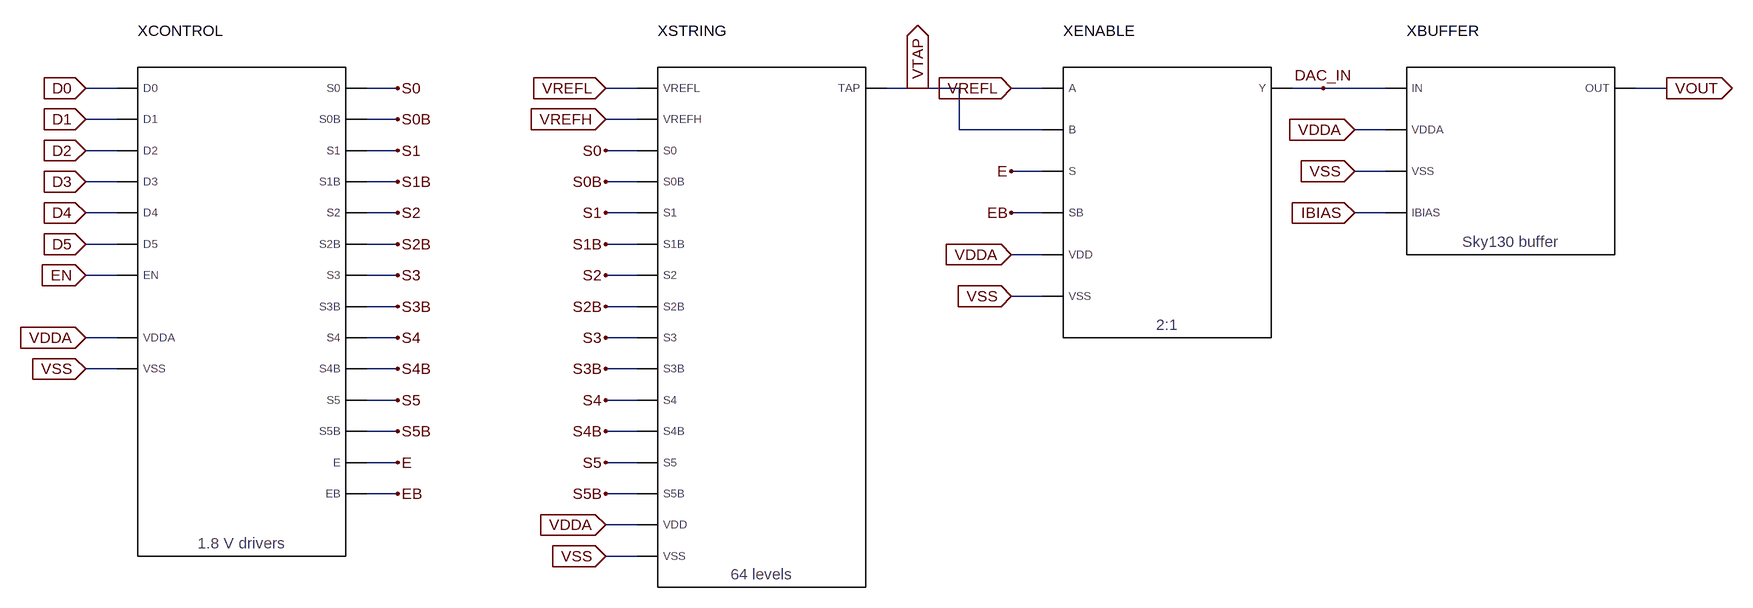
[diagram p0: schematic DAC6_Sky130_Core.asc]
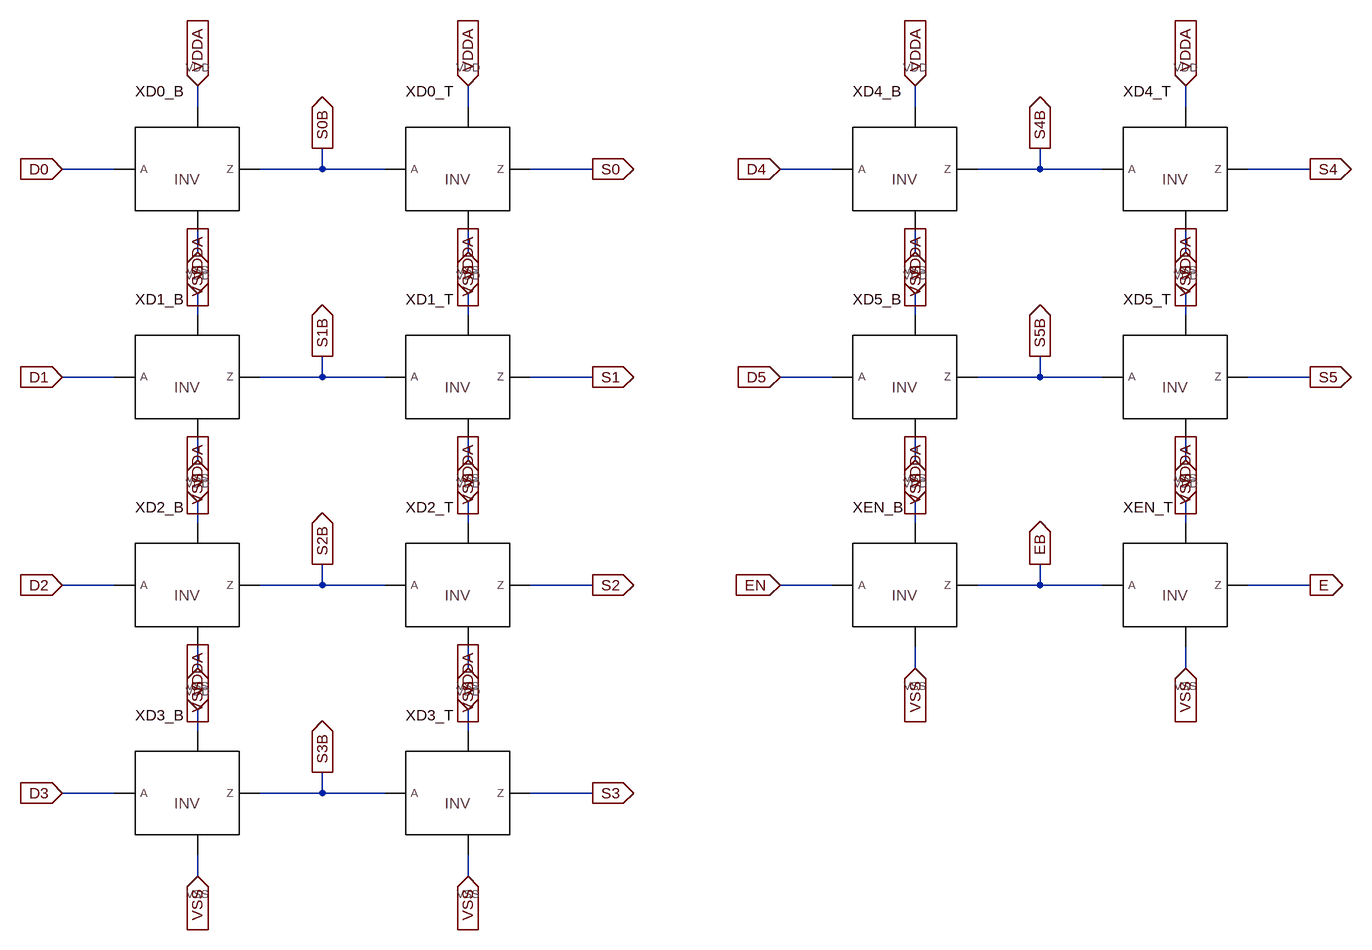
[diagram p1: sub-circuit dac_control.asc]
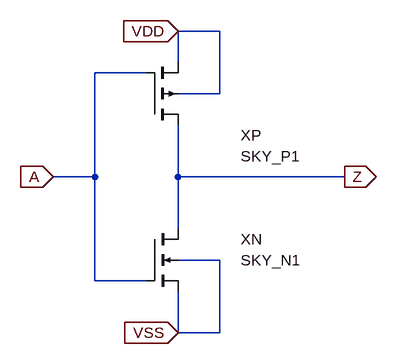
[diagram p2: sub-circuit cmos_inv.asc]
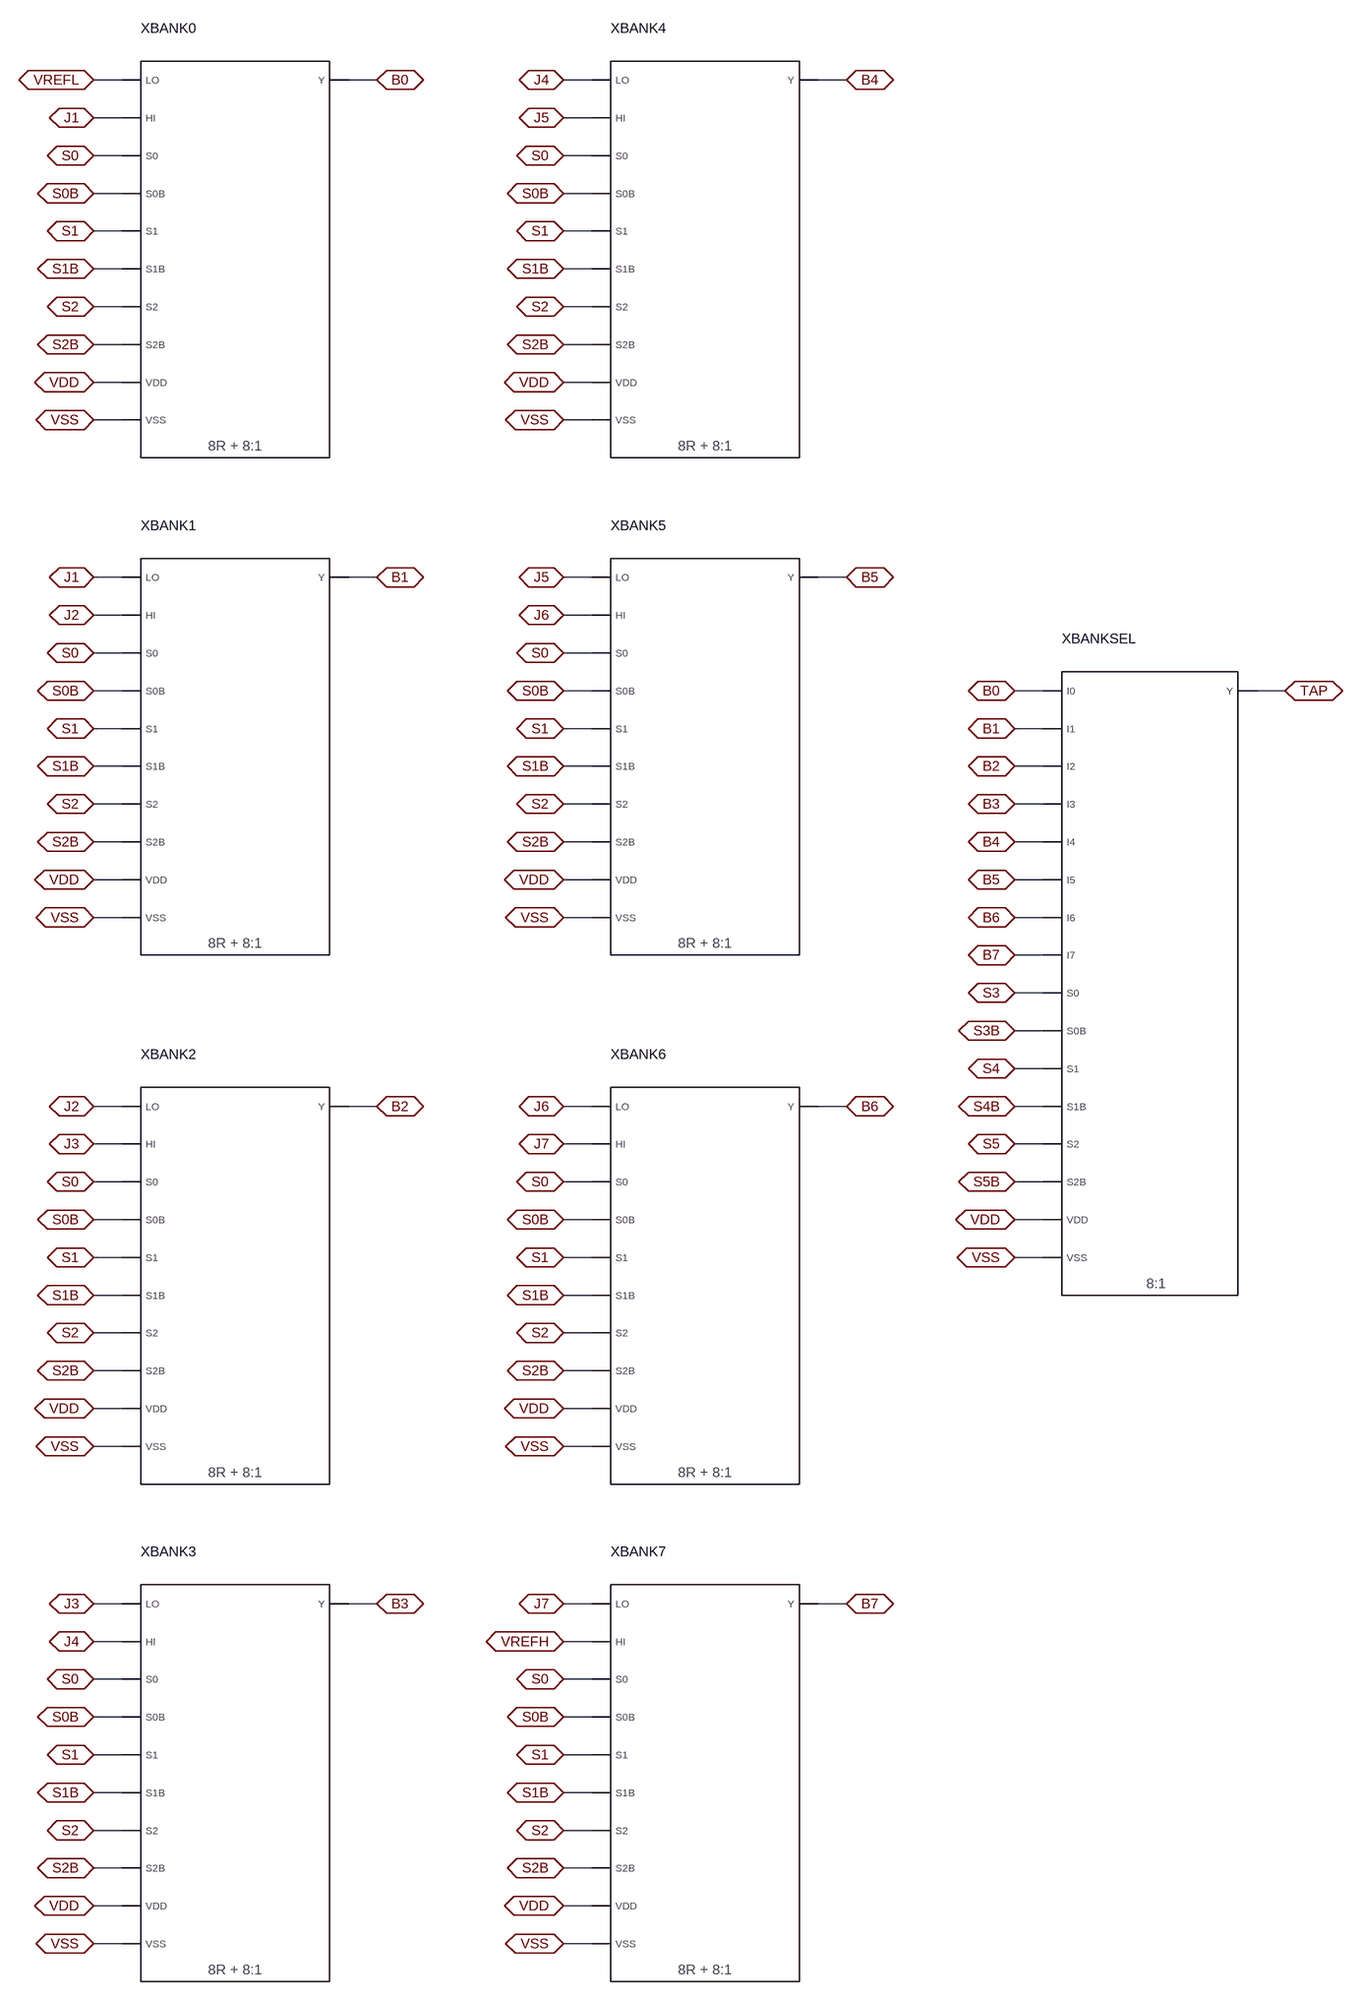
[diagram p3: sub-circuit dac_string64.asc]
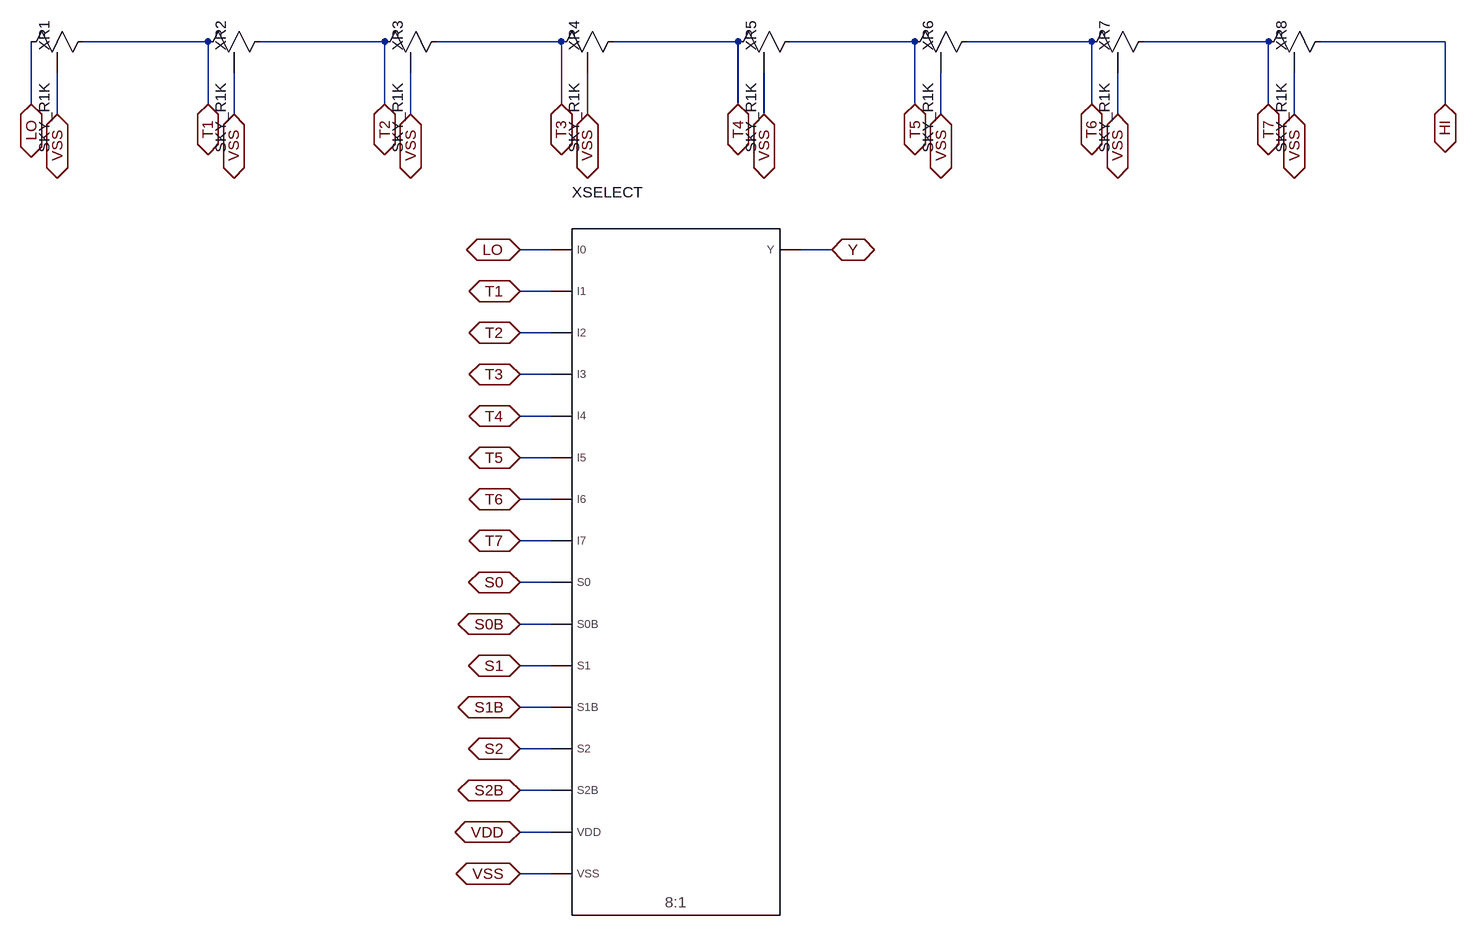
[diagram p4: sub-circuit dac_bank8.asc]
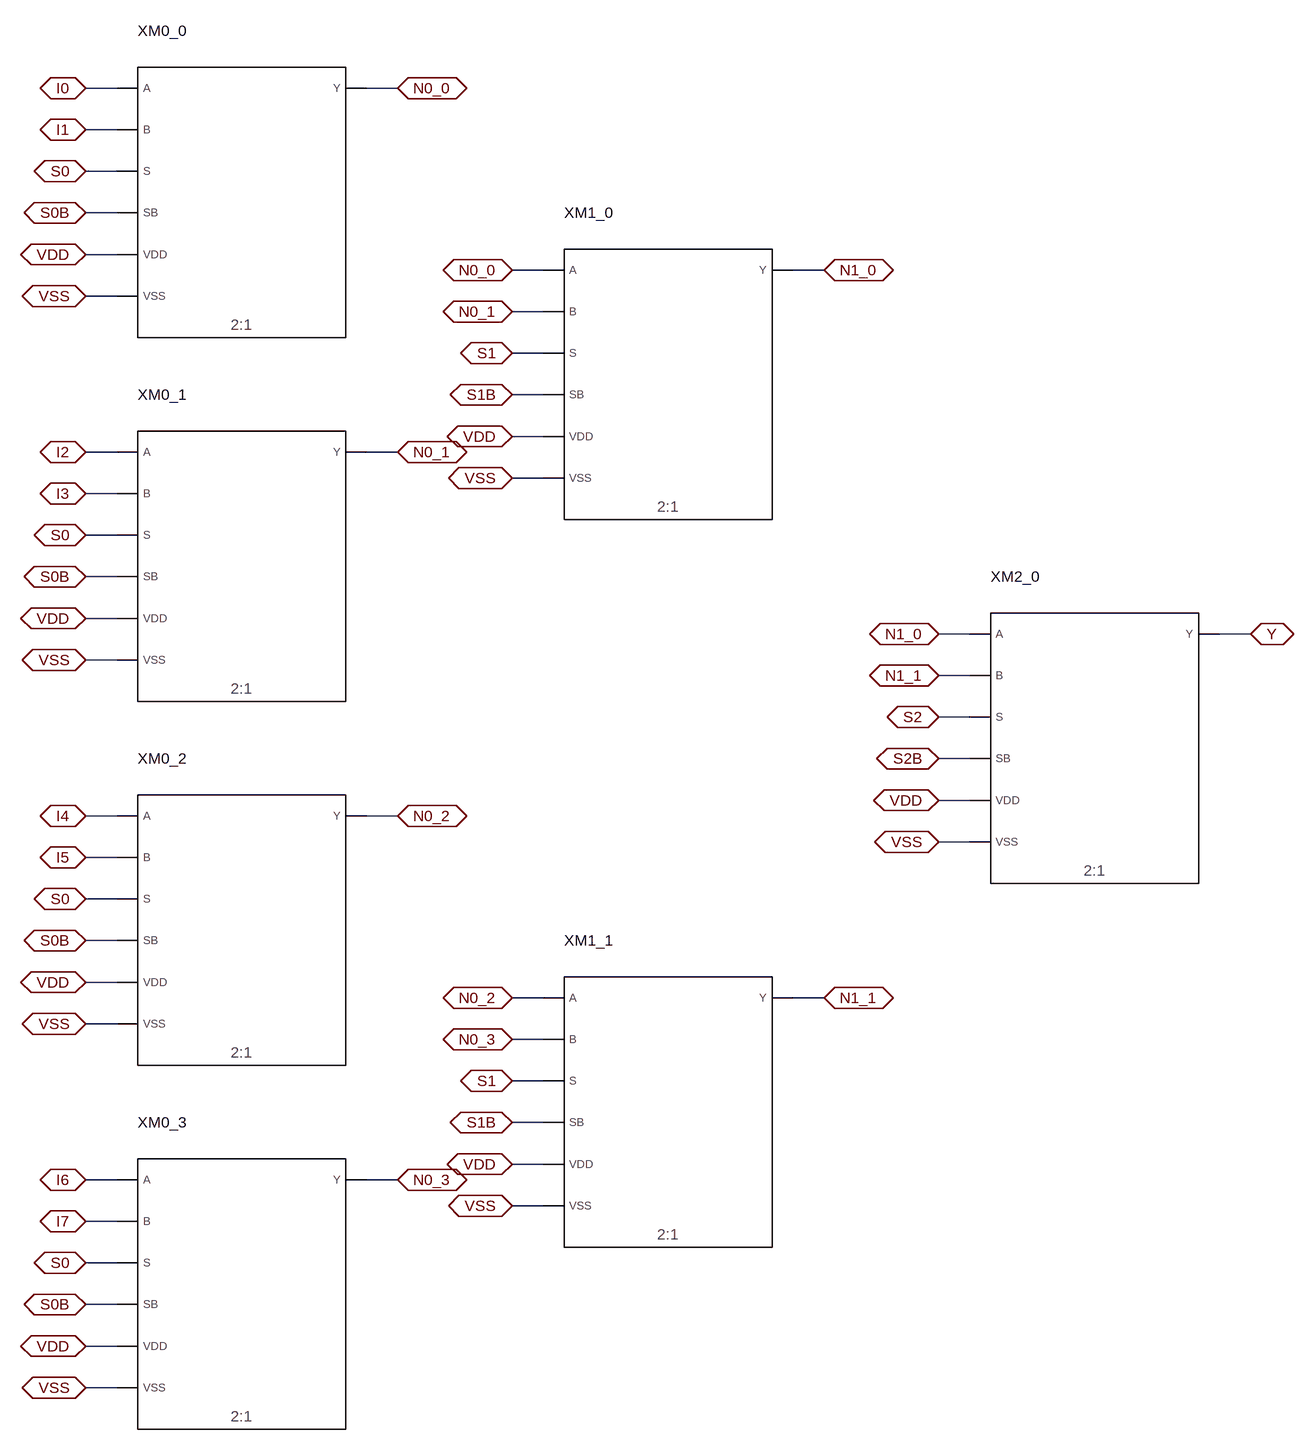
[diagram p5: sub-circuit dac_mux8.asc]
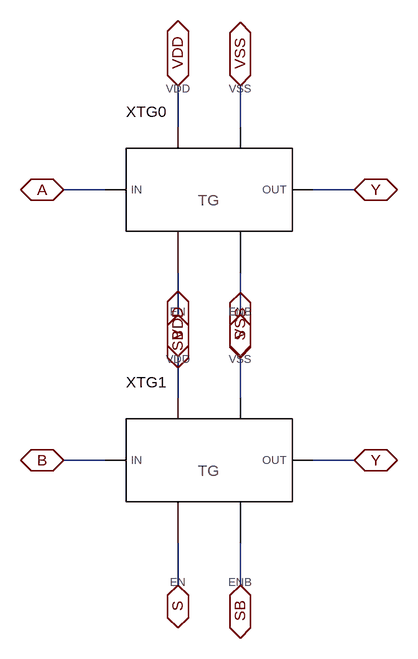
[diagram p6: sub-circuit dac_mux2.asc]
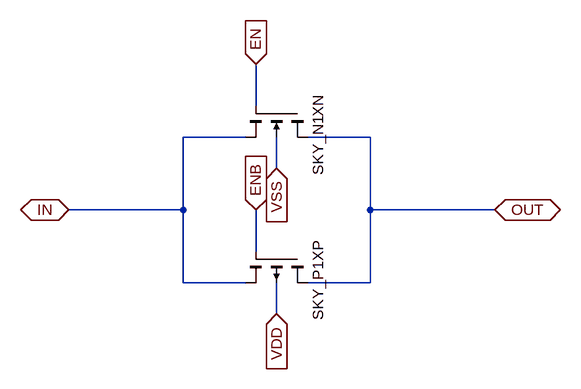
[diagram p7: sub-circuit cmos_tg.asc]
DAC6_Sky130_Core.asc, the LTspice schematic file:
Version 4.1
SHEET 1 2816 1136
WIRE 224 192 176 192
WIRE 224 240 176 240
WIRE 224 288 176 288
WIRE 224 336 176 336
WIRE 224 384 176 384
WIRE 224 432 176 432
WIRE 224 480 176 480
WIRE 224 576 176 576
WIRE 224 624 176 624
WIRE 608 192 656 192
WIRE 608 240 656 240
WIRE 608 288 656 288
WIRE 608 336 656 336
WIRE 608 384 656 384
WIRE 608 432 656 432
WIRE 608 480 656 480
WIRE 608 528 656 528
WIRE 608 576 656 576
WIRE 608 624 656 624
WIRE 608 672 656 672
WIRE 608 720 656 720
WIRE 608 768 656 768
WIRE 608 816 656 816
WIRE 1024 192 976 192
WIRE 1024 240 976 240
WIRE 1024 288 976 288
WIRE 1024 336 976 336
WIRE 1024 384 976 384
WIRE 1024 432 976 432
WIRE 1024 480 976 480
WIRE 1024 528 976 528
WIRE 1024 576 976 576
WIRE 1024 624 976 624
WIRE 1024 672 976 672
WIRE 1024 720 976 720
WIRE 1024 768 976 768
WIRE 1024 816 976 816
WIRE 1024 864 976 864
WIRE 1024 912 976 912
WIRE 1648 192 1600 192
WIRE 1648 320 1600 320
WIRE 1648 384 1600 384
WIRE 1648 448 1600 448
WIRE 1648 512 1600 512
WIRE 2176 256 2128 256
WIRE 2176 320 2128 320
WIRE 2560 192 2608 192
WIRE 1408 192 1520 192
WIRE 1520 192 1520 256
WIRE 1520 256 1648 256
WIRE 2032 192 2176 192
WIRE 2176 384 2128 384
FLAG 176 192 D0
IOPIN 176 192 In
FLAG 176 240 D1
IOPIN 176 240 In
FLAG 176 288 D2
IOPIN 176 288 In
FLAG 176 336 D3
IOPIN 176 336 In
FLAG 176 384 D4
IOPIN 176 384 In
FLAG 176 432 D5
IOPIN 176 432 In
FLAG 176 480 EN
IOPIN 176 480 In
FLAG 176 576 VDDA
IOPIN 176 576 In
FLAG 176 624 VSS
IOPIN 176 624 In
FLAG 656 192 S0
FLAG 656 240 S0B
FLAG 656 288 S1
FLAG 656 336 S1B
FLAG 656 384 S2
FLAG 656 432 S2B
FLAG 656 480 S3
FLAG 656 528 S3B
FLAG 656 576 S4
FLAG 656 624 S4B
FLAG 656 672 S5
FLAG 656 720 S5B
FLAG 656 768 E
FLAG 656 816 EB
FLAG 976 192 VREFL
IOPIN 976 192 In
FLAG 976 240 VREFH
IOPIN 976 240 In
FLAG 976 288 S0
FLAG 976 336 S0B
FLAG 976 384 S1
FLAG 976 432 S1B
FLAG 976 480 S2
FLAG 976 528 S2B
FLAG 976 576 S3
FLAG 976 624 S3B
FLAG 976 672 S4
FLAG 976 720 S4B
FLAG 976 768 S5
FLAG 976 816 S5B
FLAG 976 864 VDDA
IOPIN 976 864 In
FLAG 976 912 VSS
IOPIN 976 912 In
FLAG 1600 192 VREFL
IOPIN 1600 192 In
FLAG 1600 320 E
FLAG 1600 384 EB
FLAG 1600 448 VDDA
IOPIN 1600 448 In
FLAG 1600 512 VSS
IOPIN 1600 512 In
FLAG 2128 256 VDDA
IOPIN 2128 256 In
FLAG 2128 320 VSS
IOPIN 2128 320 In
FLAG 2608 192 VOUT
IOPIN 2608 192 Out
FLAG 1456 192 VTAP
IOPIN 1456 192 Out
FLAG 2080 192 DAC_IN
FLAG 2128 384 IBIAS
IOPIN 2128 384 In
SYMBOL DAC_Control 224 128 R0
WINDOW 0 32 -24 Left 2
SYMATTR InstName XCONTROL
SYMBOL DAC_String64 1024 128 R0
WINDOW 0 32 -24 Left 2
SYMATTR InstName XSTRING
SYMBOL DAC_Mux2 1648 128 R0
WINDOW 0 32 -24 Left 2
SYMATTR InstName XENABLE
SYMBOL DAC_Buffer 2176 128 R0
WINDOW 0 32 -24 Left 2
SYMATTR InstName XBUFFER

dac_control.asc, the sub-circuit schematic file:
Version 4.1
SHEET 1 2176 1440
WIRE 192 192 112 192
WIRE 512 192 416 192
WIRE 608 192 512 192
WIRE 512 160 512 192
WIRE 928 192 832 192
WIRE 320 96 320 64
WIRE 320 320 320 288
WIRE 736 96 736 64
WIRE 736 320 736 288
WIRE 192 512 112 512
WIRE 512 512 416 512
WIRE 608 512 512 512
WIRE 512 480 512 512
WIRE 928 512 832 512
WIRE 320 416 320 384
WIRE 320 640 320 608
WIRE 736 416 736 384
WIRE 736 640 736 608
WIRE 192 832 112 832
WIRE 512 832 416 832
WIRE 608 832 512 832
WIRE 512 800 512 832
WIRE 928 832 832 832
WIRE 320 736 320 704
WIRE 320 960 320 928
WIRE 736 736 736 704
WIRE 736 960 736 928
WIRE 192 1152 112 1152
WIRE 512 1152 416 1152
WIRE 608 1152 512 1152
WIRE 512 1120 512 1152
WIRE 928 1152 832 1152
WIRE 320 1056 320 1024
WIRE 320 1280 320 1248
WIRE 736 1056 736 1024
WIRE 736 1280 736 1248
WIRE 1296 192 1216 192
WIRE 1616 192 1520 192
WIRE 1712 192 1616 192
WIRE 1616 160 1616 192
WIRE 2032 192 1936 192
WIRE 1424 96 1424 64
WIRE 1424 320 1424 288
WIRE 1840 96 1840 64
WIRE 1840 320 1840 288
WIRE 1296 512 1216 512
WIRE 1616 512 1520 512
WIRE 1712 512 1616 512
WIRE 1616 480 1616 512
WIRE 2032 512 1936 512
WIRE 1424 416 1424 384
WIRE 1424 640 1424 608
WIRE 1840 416 1840 384
WIRE 1840 640 1840 608
WIRE 1296 832 1216 832
WIRE 1616 832 1520 832
WIRE 1712 832 1616 832
WIRE 1616 800 1616 832
WIRE 2032 832 1936 832
WIRE 1424 736 1424 704
WIRE 1424 960 1424 928
WIRE 1840 736 1840 704
WIRE 1840 960 1840 928
FLAG 112 192 D0
IOPIN 112 192 In
FLAG 512 160 S0B
IOPIN 512 160 Out
FLAG 928 192 S0
IOPIN 928 192 Out
FLAG 320 64 VDDA
IOPIN 320 64 In
FLAG 320 320 VSS
IOPIN 320 320 In
FLAG 736 64 VDDA
IOPIN 736 64 In
FLAG 736 320 VSS
IOPIN 736 320 In
FLAG 112 512 D1
IOPIN 112 512 In
FLAG 512 480 S1B
IOPIN 512 480 Out
FLAG 928 512 S1
IOPIN 928 512 Out
FLAG 320 384 VDDA
IOPIN 320 384 In
FLAG 320 640 VSS
IOPIN 320 640 In
FLAG 736 384 VDDA
IOPIN 736 384 In
FLAG 736 640 VSS
IOPIN 736 640 In
FLAG 112 832 D2
IOPIN 112 832 In
FLAG 512 800 S2B
IOPIN 512 800 Out
FLAG 928 832 S2
IOPIN 928 832 Out
FLAG 320 704 VDDA
IOPIN 320 704 In
FLAG 320 960 VSS
IOPIN 320 960 In
FLAG 736 704 VDDA
IOPIN 736 704 In
FLAG 736 960 VSS
IOPIN 736 960 In
FLAG 112 1152 D3
IOPIN 112 1152 In
FLAG 512 1120 S3B
IOPIN 512 1120 Out
FLAG 928 1152 S3
IOPIN 928 1152 Out
FLAG 320 1024 VDDA
IOPIN 320 1024 In
FLAG 320 1280 VSS
IOPIN 320 1280 In
FLAG 736 1024 VDDA
IOPIN 736 1024 In
FLAG 736 1280 VSS
IOPIN 736 1280 In
FLAG 1216 192 D4
IOPIN 1216 192 In
FLAG 1616 160 S4B
IOPIN 1616 160 Out
FLAG 2032 192 S4
IOPIN 2032 192 Out
FLAG 1424 64 VDDA
IOPIN 1424 64 In
FLAG 1424 320 VSS
IOPIN 1424 320 In
FLAG 1840 64 VDDA
IOPIN 1840 64 In
FLAG 1840 320 VSS
IOPIN 1840 320 In
FLAG 1216 512 D5
IOPIN 1216 512 In
FLAG 1616 480 S5B
IOPIN 1616 480 Out
FLAG 2032 512 S5
IOPIN 2032 512 Out
FLAG 1424 384 VDDA
IOPIN 1424 384 In
FLAG 1424 640 VSS
IOPIN 1424 640 In
FLAG 1840 384 VDDA
IOPIN 1840 384 In
FLAG 1840 640 VSS
IOPIN 1840 640 In
FLAG 1216 832 EN
IOPIN 1216 832 In
FLAG 1616 800 EB
IOPIN 1616 800 Out
FLAG 2032 832 E
IOPIN 2032 832 Out
FLAG 1424 704 VDDA
IOPIN 1424 704 In
FLAG 1424 960 VSS
IOPIN 1424 960 In
FLAG 1840 704 VDDA
IOPIN 1840 704 In
FLAG 1840 960 VSS
IOPIN 1840 960 In
SYMBOL CMOS_INV 192 96 R0
SYMATTR InstName XD0_B
SYMBOL CMOS_INV 608 96 R0
SYMATTR InstName XD0_T
SYMBOL CMOS_INV 192 416 R0
SYMATTR InstName XD1_B
SYMBOL CMOS_INV 608 416 R0
SYMATTR InstName XD1_T
SYMBOL CMOS_INV 192 736 R0
SYMATTR InstName XD2_B
SYMBOL CMOS_INV 608 736 R0
SYMATTR InstName XD2_T
SYMBOL CMOS_INV 192 1056 R0
SYMATTR InstName XD3_B
SYMBOL CMOS_INV 608 1056 R0
SYMATTR InstName XD3_T
SYMBOL CMOS_INV 1296 96 R0
SYMATTR InstName XD4_B
SYMBOL CMOS_INV 1712 96 R0
SYMATTR InstName XD4_T
SYMBOL CMOS_INV 1296 416 R0
SYMATTR InstName XD5_B
SYMBOL CMOS_INV 1712 416 R0
SYMATTR InstName XD5_T
SYMBOL CMOS_INV 1296 736 R0
SYMATTR InstName XEN_B
SYMBOL CMOS_INV 1712 736 R0
SYMATTR InstName XEN_T

cmos_inv.asc, the sub-circuit schematic file:
Version 4.1
SHEET 1 960 704
WIRE 352 192 352 272
WIRE 352 272 352 352
WIRE 352 272 608 272
WIRE 304 112 224 112
WIRE 224 112 224 272
WIRE 224 272 224 432
WIRE 224 432 304 432
WIRE 224 272 160 272
WIRE 352 96 352 48
WIRE 352 144 416 144
WIRE 416 144 416 48
WIRE 416 48 352 48
WIRE 352 448 352 512
WIRE 352 400 416 400
WIRE 416 400 416 512
WIRE 416 512 352 512
FLAG 608 272 Z
IOPIN 608 272 Out
FLAG 160 272 A
IOPIN 160 272 In
FLAG 352 48 VDD
IOPIN 352 48 In
FLAG 352 512 VSS
IOPIN 352 512 In
SYMBOL pmos4 304 192 M180
WINDOW 0 144 -16 Left 2
WINDOW 3 144 -48 Left 2
SYMATTR InstName XP
SYMATTR Value SKY_P1
SYMATTR SpiceLine w=1 l=0.15 mult=2
SYMATTR Prefix X
SYMBOL nmos4 304 352 R0
WINDOW 0 144 16 Left 2
WINDOW 3 144 48 Left 2
SYMATTR InstName XN
SYMATTR Value SKY_N1
SYMATTR SpiceLine w=1 l=0.15 mult=1
SYMATTR Prefix X

dac_string64.asc, the sub-circuit schematic file:
Version 4.1
SHEET 1 2816 3824
WIRE 192 160 144 160
WIRE 192 224 144 224
WIRE 192 288 144 288
WIRE 192 352 144 352
WIRE 192 416 144 416
WIRE 192 480 144 480
WIRE 192 544 144 544
WIRE 192 608 144 608
WIRE 192 672 144 672
WIRE 192 736 144 736
WIRE 576 160 624 160
WIRE 192 1056 144 1056
WIRE 192 1120 144 1120
WIRE 192 1184 144 1184
WIRE 192 1248 144 1248
WIRE 192 1312 144 1312
WIRE 192 1376 144 1376
WIRE 192 1440 144 1440
WIRE 192 1504 144 1504
WIRE 192 1568 144 1568
WIRE 192 1632 144 1632
WIRE 576 1056 624 1056
WIRE 192 1952 144 1952
WIRE 192 2016 144 2016
WIRE 192 2080 144 2080
WIRE 192 2144 144 2144
WIRE 192 2208 144 2208
WIRE 192 2272 144 2272
WIRE 192 2336 144 2336
WIRE 192 2400 144 2400
WIRE 192 2464 144 2464
WIRE 192 2528 144 2528
WIRE 576 1952 624 1952
WIRE 192 2848 144 2848
WIRE 192 2912 144 2912
WIRE 192 2976 144 2976
WIRE 192 3040 144 3040
WIRE 192 3104 144 3104
WIRE 192 3168 144 3168
WIRE 192 3232 144 3232
WIRE 192 3296 144 3296
WIRE 192 3360 144 3360
WIRE 192 3424 144 3424
WIRE 576 2848 624 2848
WIRE 1120 160 1072 160
WIRE 1120 224 1072 224
WIRE 1120 288 1072 288
WIRE 1120 352 1072 352
WIRE 1120 416 1072 416
WIRE 1120 480 1072 480
WIRE 1120 544 1072 544
WIRE 1120 608 1072 608
WIRE 1120 672 1072 672
WIRE 1120 736 1072 736
WIRE 1504 160 1552 160
WIRE 1120 1056 1072 1056
WIRE 1120 1120 1072 1120
WIRE 1120 1184 1072 1184
WIRE 1120 1248 1072 1248
WIRE 1120 1312 1072 1312
WIRE 1120 1376 1072 1376
WIRE 1120 1440 1072 1440
WIRE 1120 1504 1072 1504
WIRE 1120 1568 1072 1568
WIRE 1120 1632 1072 1632
WIRE 1504 1056 1552 1056
WIRE 1120 1952 1072 1952
WIRE 1120 2016 1072 2016
WIRE 1120 2080 1072 2080
WIRE 1120 2144 1072 2144
WIRE 1120 2208 1072 2208
WIRE 1120 2272 1072 2272
WIRE 1120 2336 1072 2336
WIRE 1120 2400 1072 2400
WIRE 1120 2464 1072 2464
WIRE 1120 2528 1072 2528
WIRE 1504 1952 1552 1952
WIRE 1120 2848 1072 2848
WIRE 1120 2912 1072 2912
WIRE 1120 2976 1072 2976
WIRE 1120 3040 1072 3040
WIRE 1120 3104 1072 3104
WIRE 1120 3168 1072 3168
WIRE 1120 3232 1072 3232
WIRE 1120 3296 1072 3296
WIRE 1120 3360 1072 3360
WIRE 1120 3424 1072 3424
WIRE 1504 2848 1552 2848
WIRE 2112 1248 2064 1248
WIRE 2112 1312 2064 1312
WIRE 2112 1376 2064 1376
WIRE 2112 1440 2064 1440
WIRE 2112 1504 2064 1504
WIRE 2112 1568 2064 1568
WIRE 2112 1632 2064 1632
WIRE 2112 1696 2064 1696
WIRE 2112 1760 2064 1760
WIRE 2112 1824 2064 1824
WIRE 2112 1888 2064 1888
WIRE 2112 1952 2064 1952
WIRE 2112 2016 2064 2016
WIRE 2112 2080 2064 2080
WIRE 2112 2144 2064 2144
WIRE 2112 2208 2064 2208
WIRE 2496 1248 2544 1248
FLAG 144 160 VREFL
IOPIN 144 160 BiDir
FLAG 144 224 J1
IOPIN 144 224 BiDir
FLAG 144 288 S0
IOPIN 144 288 BiDir
FLAG 144 352 S0B
IOPIN 144 352 BiDir
FLAG 144 416 S1
IOPIN 144 416 BiDir
FLAG 144 480 S1B
IOPIN 144 480 BiDir
FLAG 144 544 S2
IOPIN 144 544 BiDir
FLAG 144 608 S2B
IOPIN 144 608 BiDir
FLAG 144 672 VDD
IOPIN 144 672 BiDir
FLAG 144 736 VSS
IOPIN 144 736 BiDir
FLAG 624 160 B0
IOPIN 624 160 BiDir
FLAG 144 1056 J1
IOPIN 144 1056 BiDir
FLAG 144 1120 J2
IOPIN 144 1120 BiDir
FLAG 144 1184 S0
IOPIN 144 1184 BiDir
FLAG 144 1248 S0B
IOPIN 144 1248 BiDir
FLAG 144 1312 S1
IOPIN 144 1312 BiDir
FLAG 144 1376 S1B
IOPIN 144 1376 BiDir
FLAG 144 1440 S2
IOPIN 144 1440 BiDir
FLAG 144 1504 S2B
IOPIN 144 1504 BiDir
FLAG 144 1568 VDD
IOPIN 144 1568 BiDir
FLAG 144 1632 VSS
IOPIN 144 1632 BiDir
FLAG 624 1056 B1
IOPIN 624 1056 BiDir
FLAG 144 1952 J2
IOPIN 144 1952 BiDir
FLAG 144 2016 J3
IOPIN 144 2016 BiDir
FLAG 144 2080 S0
IOPIN 144 2080 BiDir
FLAG 144 2144 S0B
IOPIN 144 2144 BiDir
FLAG 144 2208 S1
IOPIN 144 2208 BiDir
FLAG 144 2272 S1B
IOPIN 144 2272 BiDir
FLAG 144 2336 S2
IOPIN 144 2336 BiDir
FLAG 144 2400 S2B
IOPIN 144 2400 BiDir
FLAG 144 2464 VDD
IOPIN 144 2464 BiDir
FLAG 144 2528 VSS
IOPIN 144 2528 BiDir
FLAG 624 1952 B2
IOPIN 624 1952 BiDir
FLAG 144 2848 J3
IOPIN 144 2848 BiDir
FLAG 144 2912 J4
IOPIN 144 2912 BiDir
FLAG 144 2976 S0
IOPIN 144 2976 BiDir
FLAG 144 3040 S0B
IOPIN 144 3040 BiDir
FLAG 144 3104 S1
IOPIN 144 3104 BiDir
FLAG 144 3168 S1B
IOPIN 144 3168 BiDir
FLAG 144 3232 S2
IOPIN 144 3232 BiDir
FLAG 144 3296 S2B
IOPIN 144 3296 BiDir
FLAG 144 3360 VDD
IOPIN 144 3360 BiDir
FLAG 144 3424 VSS
IOPIN 144 3424 BiDir
FLAG 624 2848 B3
IOPIN 624 2848 BiDir
FLAG 1072 160 J4
IOPIN 1072 160 BiDir
FLAG 1072 224 J5
IOPIN 1072 224 BiDir
FLAG 1072 288 S0
IOPIN 1072 288 BiDir
FLAG 1072 352 S0B
IOPIN 1072 352 BiDir
FLAG 1072 416 S1
IOPIN 1072 416 BiDir
FLAG 1072 480 S1B
IOPIN 1072 480 BiDir
FLAG 1072 544 S2
IOPIN 1072 544 BiDir
FLAG 1072 608 S2B
IOPIN 1072 608 BiDir
FLAG 1072 672 VDD
IOPIN 1072 672 BiDir
FLAG 1072 736 VSS
IOPIN 1072 736 BiDir
FLAG 1552 160 B4
IOPIN 1552 160 BiDir
FLAG 1072 1056 J5
IOPIN 1072 1056 BiDir
FLAG 1072 1120 J6
IOPIN 1072 1120 BiDir
FLAG 1072 1184 S0
IOPIN 1072 1184 BiDir
FLAG 1072 1248 S0B
IOPIN 1072 1248 BiDir
FLAG 1072 1312 S1
IOPIN 1072 1312 BiDir
FLAG 1072 1376 S1B
IOPIN 1072 1376 BiDir
FLAG 1072 1440 S2
IOPIN 1072 1440 BiDir
FLAG 1072 1504 S2B
IOPIN 1072 1504 BiDir
FLAG 1072 1568 VDD
IOPIN 1072 1568 BiDir
FLAG 1072 1632 VSS
IOPIN 1072 1632 BiDir
FLAG 1552 1056 B5
IOPIN 1552 1056 BiDir
FLAG 1072 1952 J6
IOPIN 1072 1952 BiDir
FLAG 1072 2016 J7
IOPIN 1072 2016 BiDir
FLAG 1072 2080 S0
IOPIN 1072 2080 BiDir
FLAG 1072 2144 S0B
IOPIN 1072 2144 BiDir
FLAG 1072 2208 S1
IOPIN 1072 2208 BiDir
FLAG 1072 2272 S1B
IOPIN 1072 2272 BiDir
FLAG 1072 2336 S2
IOPIN 1072 2336 BiDir
FLAG 1072 2400 S2B
IOPIN 1072 2400 BiDir
FLAG 1072 2464 VDD
IOPIN 1072 2464 BiDir
FLAG 1072 2528 VSS
IOPIN 1072 2528 BiDir
FLAG 1552 1952 B6
IOPIN 1552 1952 BiDir
FLAG 1072 2848 J7
IOPIN 1072 2848 BiDir
FLAG 1072 2912 VREFH
IOPIN 1072 2912 BiDir
FLAG 1072 2976 S0
IOPIN 1072 2976 BiDir
FLAG 1072 3040 S0B
IOPIN 1072 3040 BiDir
FLAG 1072 3104 S1
IOPIN 1072 3104 BiDir
FLAG 1072 3168 S1B
IOPIN 1072 3168 BiDir
FLAG 1072 3232 S2
IOPIN 1072 3232 BiDir
FLAG 1072 3296 S2B
IOPIN 1072 3296 BiDir
FLAG 1072 3360 VDD
IOPIN 1072 3360 BiDir
FLAG 1072 3424 VSS
IOPIN 1072 3424 BiDir
FLAG 1552 2848 B7
IOPIN 1552 2848 BiDir
FLAG 2064 1248 B0
IOPIN 2064 1248 BiDir
FLAG 2064 1312 B1
IOPIN 2064 1312 BiDir
FLAG 2064 1376 B2
IOPIN 2064 1376 BiDir
FLAG 2064 1440 B3
IOPIN 2064 1440 BiDir
FLAG 2064 1504 B4
IOPIN 2064 1504 BiDir
FLAG 2064 1568 B5
IOPIN 2064 1568 BiDir
FLAG 2064 1632 B6
IOPIN 2064 1632 BiDir
FLAG 2064 1696 B7
IOPIN 2064 1696 BiDir
FLAG 2064 1760 S3
IOPIN 2064 1760 BiDir
FLAG 2064 1824 S3B
IOPIN 2064 1824 BiDir
FLAG 2064 1888 S4
IOPIN 2064 1888 BiDir
FLAG 2064 1952 S4B
IOPIN 2064 1952 BiDir
FLAG 2064 2016 S5
IOPIN 2064 2016 BiDir
FLAG 2064 2080 S5B
IOPIN 2064 2080 BiDir
FLAG 2064 2144 VDD
IOPIN 2064 2144 BiDir
FLAG 2064 2208 VSS
IOPIN 2064 2208 BiDir
FLAG 2544 1248 TAP
IOPIN 2544 1248 BiDir
SYMBOL DAC_Bank8 192 96 R0
WINDOW 0 32 -24 Left 2
SYMATTR InstName XBANK0
SYMBOL DAC_Bank8 192 992 R0
WINDOW 0 32 -24 Left 2
SYMATTR InstName XBANK1
SYMBOL DAC_Bank8 192 1888 R0
WINDOW 0 32 -24 Left 2
SYMATTR InstName XBANK2
SYMBOL DAC_Bank8 192 2784 R0
WINDOW 0 32 -24 Left 2
SYMATTR InstName XBANK3
SYMBOL DAC_Bank8 1120 96 R0
WINDOW 0 32 -24 Left 2
SYMATTR InstName XBANK4
SYMBOL DAC_Bank8 1120 992 R0
WINDOW 0 32 -24 Left 2
SYMATTR InstName XBANK5
SYMBOL DAC_Bank8 1120 1888 R0
WINDOW 0 32 -24 Left 2
SYMATTR InstName XBANK6
SYMBOL DAC_Bank8 1120 2784 R0
WINDOW 0 32 -24 Left 2
SYMATTR InstName XBANK7
SYMBOL DAC_Mux8 2112 1184 R0
WINDOW 0 32 -24 Left 2
SYMATTR InstName XBANKSEL

dac_bank8.asc, the sub-circuit schematic file:
Version 4.1
SHEET 1 2512 1664
WIRE 160 224 160 320
WIRE 240 224 432 224
WIRE 432 224 432 320
WIRE 512 224 704 224
WIRE 704 224 704 320
WIRE 784 224 976 224
WIRE 976 224 976 320
WIRE 1056 224 1248 224
WIRE 1248 224 1248 320
WIRE 1328 224 1520 224
WIRE 1520 224 1520 320
WIRE 1600 224 1792 224
WIRE 1792 224 1792 320
WIRE 1872 224 2064 224
WIRE 2064 224 2064 320
WIRE 2144 224 2336 224
WIRE 2336 224 2336 320
WIRE 960 544 912 544
WIRE 960 608 912 608
WIRE 960 672 912 672
WIRE 960 736 912 736
WIRE 960 800 912 800
WIRE 960 864 912 864
WIRE 960 928 912 928
WIRE 960 992 912 992
WIRE 960 1056 912 1056
WIRE 960 1120 912 1120
WIRE 960 1184 912 1184
WIRE 960 1248 912 1248
WIRE 960 1312 912 1312
WIRE 960 1376 912 1376
WIRE 960 1440 912 1440
WIRE 960 1504 912 1504
WIRE 1344 544 1392 544
WIRE 200 272 200 336
WIRE 472 272 472 336
WIRE 744 272 744 336
WIRE 1016 272 1016 336
WIRE 1288 272 1288 336
WIRE 1560 272 1560 336
WIRE 1832 272 1832 336
WIRE 2104 272 2104 336
FLAG 160 320 LO
IOPIN 160 320 BiDir
FLAG 432 320 T1
IOPIN 432 320 BiDir
FLAG 704 320 T2
IOPIN 704 320 BiDir
FLAG 976 320 T3
IOPIN 976 320 BiDir
FLAG 1248 320 T4
IOPIN 1248 320 BiDir
FLAG 1520 320 T5
IOPIN 1520 320 BiDir
FLAG 1792 320 T6
IOPIN 1792 320 BiDir
FLAG 2064 320 T7
IOPIN 2064 320 BiDir
FLAG 2336 320 HI
IOPIN 2336 320 BiDir
FLAG 912 544 LO
IOPIN 912 544 BiDir
FLAG 912 608 T1
IOPIN 912 608 BiDir
FLAG 912 672 T2
IOPIN 912 672 BiDir
FLAG 912 736 T3
IOPIN 912 736 BiDir
FLAG 912 800 T4
IOPIN 912 800 BiDir
FLAG 912 864 T5
IOPIN 912 864 BiDir
FLAG 912 928 T6
IOPIN 912 928 BiDir
FLAG 912 992 T7
IOPIN 912 992 BiDir
FLAG 912 1056 S0
IOPIN 912 1056 BiDir
FLAG 912 1120 S0B
IOPIN 912 1120 BiDir
FLAG 912 1184 S1
IOPIN 912 1184 BiDir
FLAG 912 1248 S1B
IOPIN 912 1248 BiDir
FLAG 912 1312 S2
IOPIN 912 1312 BiDir
FLAG 912 1376 S2B
IOPIN 912 1376 BiDir
FLAG 912 1440 VDD
IOPIN 912 1440 BiDir
FLAG 912 1504 VSS
IOPIN 912 1504 BiDir
FLAG 1392 544 Y
IOPIN 1392 544 BiDir
FLAG 200 336 VSS
IOPIN 200 336 BiDir
FLAG 472 336 VSS
IOPIN 472 336 BiDir
FLAG 744 336 VSS
IOPIN 744 336 BiDir
FLAG 1016 336 VSS
IOPIN 1016 336 BiDir
FLAG 1288 336 VSS
IOPIN 1288 336 BiDir
FLAG 1560 336 VSS
IOPIN 1560 336 BiDir
FLAG 1832 336 VSS
IOPIN 1832 336 BiDir
FLAG 2104 336 VSS
IOPIN 2104 336 BiDir
SYMBOL Sky_R 256 208 R90
WINDOW 0 -16 76 Left 2
WINDOW 3 80 76 Left 2
SYMATTR InstName XR1
SYMATTR Value SKY_R1K
SYMATTR Prefix X
SYMBOL Sky_R 528 208 R90
WINDOW 0 -16 76 Left 2
WINDOW 3 80 76 Left 2
SYMATTR InstName XR2
SYMATTR Value SKY_R1K
SYMATTR Prefix X
SYMBOL Sky_R 800 208 R90
WINDOW 0 -16 76 Left 2
WINDOW 3 80 76 Left 2
SYMATTR InstName XR3
SYMATTR Value SKY_R1K
SYMATTR Prefix X
SYMBOL Sky_R 1072 208 R90
WINDOW 0 -16 76 Left 2
WINDOW 3 80 76 Left 2
SYMATTR InstName XR4
SYMATTR Value SKY_R1K
SYMATTR Prefix X
SYMBOL Sky_R 1344 208 R90
WINDOW 0 -16 76 Left 2
WINDOW 3 80 76 Left 2
SYMATTR InstName XR5
SYMATTR Value SKY_R1K
SYMATTR Prefix X
SYMBOL Sky_R 1616 208 R90
WINDOW 0 -16 76 Left 2
WINDOW 3 80 76 Left 2
SYMATTR InstName XR6
SYMATTR Value SKY_R1K
SYMATTR Prefix X
SYMBOL Sky_R 1888 208 R90
WINDOW 0 -16 76 Left 2
WINDOW 3 80 76 Left 2
SYMATTR InstName XR7
SYMATTR Value SKY_R1K
SYMATTR Prefix X
SYMBOL Sky_R 2160 208 R90
WINDOW 0 -16 76 Left 2
WINDOW 3 80 76 Left 2
SYMATTR InstName XR8
SYMATTR Value SKY_R1K
SYMATTR Prefix X
SYMBOL DAC_Mux8 960 480 R0
WINDOW 0 32 -24 Left 2
SYMATTR InstName XSELECT

dac_mux8.asc, the sub-circuit schematic file:
Version 4.1
SHEET 1 2112 2448
WIRE 192 160 144 160
WIRE 192 224 144 224
WIRE 192 288 144 288
WIRE 192 352 144 352
WIRE 192 416 144 416
WIRE 192 480 144 480
WIRE 576 160 624 160
WIRE 192 720 144 720
WIRE 192 784 144 784
WIRE 192 848 144 848
WIRE 192 912 144 912
WIRE 192 976 144 976
WIRE 192 1040 144 1040
WIRE 576 720 624 720
WIRE 192 1280 144 1280
WIRE 192 1344 144 1344
WIRE 192 1408 144 1408
WIRE 192 1472 144 1472
WIRE 192 1536 144 1536
WIRE 192 1600 144 1600
WIRE 576 1280 624 1280
WIRE 192 1840 144 1840
WIRE 192 1904 144 1904
WIRE 192 1968 144 1968
WIRE 192 2032 144 2032
WIRE 192 2096 144 2096
WIRE 192 2160 144 2160
WIRE 576 1840 624 1840
WIRE 848 440 800 440
WIRE 848 504 800 504
WIRE 848 568 800 568
WIRE 848 632 800 632
WIRE 848 696 800 696
WIRE 848 760 800 760
WIRE 1232 440 1280 440
WIRE 848 1560 800 1560
WIRE 848 1624 800 1624
WIRE 848 1688 800 1688
WIRE 848 1752 800 1752
WIRE 848 1816 800 1816
WIRE 848 1880 800 1880
WIRE 1232 1560 1280 1560
WIRE 1504 1000 1456 1000
WIRE 1504 1064 1456 1064
WIRE 1504 1128 1456 1128
WIRE 1504 1192 1456 1192
WIRE 1504 1256 1456 1256
WIRE 1504 1320 1456 1320
WIRE 1888 1000 1936 1000
FLAG 144 160 I0
IOPIN 144 160 BiDir
FLAG 144 224 I1
IOPIN 144 224 BiDir
FLAG 144 288 S0
IOPIN 144 288 BiDir
FLAG 144 352 S0B
IOPIN 144 352 BiDir
FLAG 144 416 VDD
IOPIN 144 416 BiDir
FLAG 144 480 VSS
IOPIN 144 480 BiDir
FLAG 624 160 N0_0
IOPIN 624 160 BiDir
FLAG 144 720 I2
IOPIN 144 720 BiDir
FLAG 144 784 I3
IOPIN 144 784 BiDir
FLAG 144 848 S0
IOPIN 144 848 BiDir
FLAG 144 912 S0B
IOPIN 144 912 BiDir
FLAG 144 976 VDD
IOPIN 144 976 BiDir
FLAG 144 1040 VSS
IOPIN 144 1040 BiDir
FLAG 624 720 N0_1
IOPIN 624 720 BiDir
FLAG 144 1280 I4
IOPIN 144 1280 BiDir
FLAG 144 1344 I5
IOPIN 144 1344 BiDir
FLAG 144 1408 S0
IOPIN 144 1408 BiDir
FLAG 144 1472 S0B
IOPIN 144 1472 BiDir
FLAG 144 1536 VDD
IOPIN 144 1536 BiDir
FLAG 144 1600 VSS
IOPIN 144 1600 BiDir
FLAG 624 1280 N0_2
IOPIN 624 1280 BiDir
FLAG 144 1840 I6
IOPIN 144 1840 BiDir
FLAG 144 1904 I7
IOPIN 144 1904 BiDir
FLAG 144 1968 S0
IOPIN 144 1968 BiDir
FLAG 144 2032 S0B
IOPIN 144 2032 BiDir
FLAG 144 2096 VDD
IOPIN 144 2096 BiDir
FLAG 144 2160 VSS
IOPIN 144 2160 BiDir
FLAG 624 1840 N0_3
IOPIN 624 1840 BiDir
FLAG 800 440 N0_0
IOPIN 800 440 BiDir
FLAG 800 504 N0_1
IOPIN 800 504 BiDir
FLAG 800 568 S1
IOPIN 800 568 BiDir
FLAG 800 632 S1B
IOPIN 800 632 BiDir
FLAG 800 696 VDD
IOPIN 800 696 BiDir
FLAG 800 760 VSS
IOPIN 800 760 BiDir
FLAG 1280 440 N1_0
IOPIN 1280 440 BiDir
FLAG 800 1560 N0_2
IOPIN 800 1560 BiDir
FLAG 800 1624 N0_3
IOPIN 800 1624 BiDir
FLAG 800 1688 S1
IOPIN 800 1688 BiDir
FLAG 800 1752 S1B
IOPIN 800 1752 BiDir
FLAG 800 1816 VDD
IOPIN 800 1816 BiDir
FLAG 800 1880 VSS
IOPIN 800 1880 BiDir
FLAG 1280 1560 N1_1
IOPIN 1280 1560 BiDir
FLAG 1456 1000 N1_0
IOPIN 1456 1000 BiDir
FLAG 1456 1064 N1_1
IOPIN 1456 1064 BiDir
FLAG 1456 1128 S2
IOPIN 1456 1128 BiDir
FLAG 1456 1192 S2B
IOPIN 1456 1192 BiDir
FLAG 1456 1256 VDD
IOPIN 1456 1256 BiDir
FLAG 1456 1320 VSS
IOPIN 1456 1320 BiDir
FLAG 1936 1000 Y
IOPIN 1936 1000 BiDir
SYMBOL DAC_Mux2 192 96 R0
WINDOW 0 32 -24 Left 2
SYMATTR InstName XM0_0
SYMBOL DAC_Mux2 192 656 R0
WINDOW 0 32 -24 Left 2
SYMATTR InstName XM0_1
SYMBOL DAC_Mux2 192 1216 R0
WINDOW 0 32 -24 Left 2
SYMATTR InstName XM0_2
SYMBOL DAC_Mux2 192 1776 R0
WINDOW 0 32 -24 Left 2
SYMATTR InstName XM0_3
SYMBOL DAC_Mux2 848 376 R0
WINDOW 0 32 -24 Left 2
SYMATTR InstName XM1_0
SYMBOL DAC_Mux2 848 1496 R0
WINDOW 0 32 -24 Left 2
SYMATTR InstName XM1_1
SYMBOL DAC_Mux2 1504 936 R0
WINDOW 0 32 -24 Left 2
SYMATTR InstName XM2_0

dac_mux2.asc, the sub-circuit schematic file:
Version 4.1
SHEET 1 1344 1008
WIRE 352 224 288 224
WIRE 672 224 736 224
WIRE 464 128 464 64
WIRE 560 128 560 64
WIRE 464 352 464 416
WIRE 560 352 560 416
WIRE 352 640 288 640
WIRE 672 640 736 640
WIRE 464 544 464 480
WIRE 560 544 560 480
WIRE 464 768 464 832
WIRE 560 768 560 832
FLAG 288 224 A
IOPIN 288 224 BiDir
FLAG 736 224 Y
IOPIN 736 224 BiDir
FLAG 464 64 VDD
IOPIN 464 64 BiDir
FLAG 560 64 VSS
IOPIN 560 64 BiDir
FLAG 464 416 SB
IOPIN 464 416 BiDir
FLAG 560 416 S
IOPIN 560 416 BiDir
FLAG 288 640 B
IOPIN 288 640 BiDir
FLAG 736 640 Y
IOPIN 736 640 BiDir
FLAG 464 480 VDD
IOPIN 464 480 BiDir
FLAG 560 480 VSS
IOPIN 560 480 BiDir
FLAG 464 832 S
IOPIN 464 832 BiDir
FLAG 560 832 SB
IOPIN 560 832 BiDir
SYMBOL CMOS_TG 352 128 R0
WINDOW 0 32 -24 Left 2
SYMATTR InstName XTG0
SYMBOL CMOS_TG 352 544 R0
WINDOW 0 32 -24 Left 2
SYMATTR InstName XTG1

cmos_tg.asc, the sub-circuit schematic file:
Version 4.1
SHEET 1 960 704
WIRE 304 192 400 192
WIRE 496 192 592 192
WIRE 416 144 416 80
WIRE 448 192 448 240
WIRE 304 416 400 416
WIRE 496 416 592 416
WIRE 416 368 416 304
WIRE 448 416 448 464
WIRE 304 192 304 304
WIRE 304 304 304 416
WIRE 128 304 304 304
WIRE 592 192 592 304
WIRE 592 304 592 416
WIRE 592 304 784 304
FLAG 416 80 EN
IOPIN 416 80 In
FLAG 448 240 VSS
IOPIN 448 240 In
FLAG 416 304 ENB
IOPIN 416 304 In
FLAG 448 464 VDD
IOPIN 448 464 In
FLAG 128 304 IN
IOPIN 128 304 BiDir
FLAG 784 304 OUT
IOPIN 784 304 BiDir
SYMBOL nmos4 496 144 R90
WINDOW 0 -16 -16 Left 2
WINDOW 3 16 -16 Left 2
SYMATTR InstName XN
SYMATTR Value SKY_N1
SYMATTR SpiceLine w=7 l=0.5 mult=4
SYMATTR Prefix X
SYMBOL pmos4 496 368 R90
WINDOW 0 -16 -16 Left 2
WINDOW 3 16 -16 Left 2
SYMATTR InstName XP
SYMATTR Value SKY_P1
SYMATTR SpiceLine w=7 l=0.5 mult=8
SYMATTR Prefix X

dac_buffer.asc, the sub-circuit schematic file:
Version 4.1
SHEET 1 1104 752
WIRE 336 240 240 240
WIRE 336 368 240 368
WIRE 336 432 240 432
WIRE 336 496 240 496
WIRE 336 304 160 304
WIRE 160 304 160 608
WIRE 160 608 848 608
WIRE 848 608 848 240
WIRE 720 240 992 240
FLAG 240 240 IN
IOPIN 240 240 BiDir
FLAG 240 368 VDDA
IOPIN 240 368 BiDir
FLAG 240 432 VSS
IOPIN 240 432 BiDir
FLAG 240 496 IBIAS
IOPIN 240 496 BiDir
FLAG 992 240 OUT
IOPIN 992 240 Out
SYMBOL Sky_OTA 336 176 R0
WINDOW 0 32 -24 Left 2
SYMATTR InstName XOTA

sky_ota.asc, the sub-circuit schematic file:
Version 4.1
SHEET 1 1904 1312
WIRE 208 192 144 192
WIRE 208 256 144 256
WIRE 208 320 144 320
WIRE 592 192 656 192
WIRE 800 192 736 192
WIRE 800 256 736 256
WIRE 800 320 736 320
WIRE 800 384 736 384
WIRE 800 448 736 448
WIRE 1184 192 1248 192
WIRE 800 736 736 736
WIRE 800 800 736 800
WIRE 800 864 736 864
WIRE 800 928 736 928
WIRE 800 992 736 992
WIRE 1184 736 1248 736
WIRE 1392 480 1328 480
WIRE 1392 544 1328 544
WIRE 1392 608 1328 608
WIRE 1392 672 1328 672
WIRE 1776 480 1840 480
FLAG 144 192 VDD
IOPIN 144 192 BiDir
FLAG 144 256 VSS
IOPIN 144 256 BiDir
FLAG 144 320 IBIAS
IOPIN 144 320 BiDir
FLAG 656 192 BP
IOPIN 656 192 BiDir
FLAG 736 192 INP
IOPIN 736 192 BiDir
FLAG 736 256 INM
IOPIN 736 256 BiDir
FLAG 736 320 VDD
IOPIN 736 320 BiDir
FLAG 736 384 VSS
IOPIN 736 384 BiDir
FLAG 736 448 BP
IOPIN 736 448 BiDir
FLAG 1248 192 G2
IOPIN 1248 192 BiDir
FLAG 736 736 INP
IOPIN 736 736 BiDir
FLAG 736 800 INM
IOPIN 736 800 BiDir
FLAG 736 864 VDD
IOPIN 736 864 BiDir
FLAG 736 928 VSS
IOPIN 736 928 BiDir
FLAG 736 992 IBIAS
IOPIN 736 992 BiDir
FLAG 1248 736 G2
IOPIN 1248 736 BiDir
FLAG 1328 480 G2
IOPIN 1328 480 BiDir
FLAG 1328 544 BP
IOPIN 1328 544 BiDir
FLAG 1328 608 VDD
IOPIN 1328 608 BiDir
FLAG 1328 672 VSS
IOPIN 1328 672 BiDir
FLAG 1840 480 OUT
IOPIN 1840 480 BiDir
SYMBOL Sky_Bias 208 128 R0
WINDOW 0 32 -24 Left 2
SYMATTR InstName XBIAS
SYMBOL Sky_InputP 800 128 R0
WINDOW 0 32 -24 Left 2
SYMATTR InstName XPIN
SYMBOL Sky_InputN 800 672 R0
WINDOW 0 32 -24 Left 2
SYMATTR InstName XNIN
SYMBOL Sky_Output 1392 416 R0
WINDOW 0 32 -24 Left 2
SYMATTR InstName XOUTPUT

sky_bias.asc, the sub-circuit schematic file:
Version 4.1
SHEET 1 1728 800
WIRE 208 160 208 96
WIRE 160 240 96 240
WIRE 208 256 208 320
WIRE 208 208 272 208
WIRE 736 160 736 96
WIRE 688 240 624 240
WIRE 736 256 736 320
WIRE 736 208 800 208
WIRE 1264 256 1264 320
WIRE 1216 176 1152 176
WIRE 1264 160 1264 96
WIRE 1264 208 1328 208
FLAG 208 96 IBIAS
IOPIN 208 96 BiDir
FLAG 96 240 IBIAS
IOPIN 96 240 BiDir
FLAG 208 320 VSS
IOPIN 208 320 BiDir
FLAG 272 208 VSS
IOPIN 272 208 BiDir
FLAG 736 96 BP
IOPIN 736 96 BiDir
FLAG 624 240 IBIAS
IOPIN 624 240 BiDir
FLAG 736 320 VSS
IOPIN 736 320 BiDir
FLAG 800 208 VSS
IOPIN 800 208 BiDir
FLAG 1264 320 BP
IOPIN 1264 320 BiDir
FLAG 1152 176 BP
IOPIN 1152 176 BiDir
FLAG 1264 96 VDD
IOPIN 1264 96 BiDir
FLAG 1328 208 VDD
IOPIN 1328 208 BiDir
SYMBOL nmos4 160 160 R0
WINDOW 0 208 16 Left 2
WINDOW 3 208 48 Left 2
SYMATTR InstName XNREF
SYMATTR Value SKY_N1
SYMATTR SpiceLine w=7 l=4 mult=1
SYMATTR Prefix X
SYMBOL nmos4 688 160 R0
WINDOW 0 208 16 Left 2
WINDOW 3 208 48 Left 2
SYMATTR InstName XNBIAS
SYMATTR Value SKY_N1
SYMATTR SpiceLine w=7 l=4 mult=1
SYMATTR Prefix X
SYMBOL pmos4 1216 256 M180
WINDOW 0 208 80 Left 2
WINDOW 3 208 48 Left 2
SYMATTR InstName XPREF
SYMATTR Value SKY_P1
SYMATTR SpiceLine w=7 l=4 mult=1
SYMATTR Prefix X
TEXT 368 240 Left 2 ;7/4 x1
TEXT 896 240 Left 2 ;7/4 x1
TEXT 1424 240 Left 2 ;7/4 x1

sky_inputp.asc, the sub-circuit schematic file:
Version 4.1
SHEET 1 1728 1408
WIRE 208 256 208 320
WIRE 160 176 96 176
WIRE 208 160 208 96
WIRE 208 208 272 208
WIRE 736 256 736 320
WIRE 688 176 624 176
WIRE 736 160 736 96
WIRE 736 208 800 208
WIRE 1264 256 1264 320
WIRE 1216 176 1152 176
WIRE 1264 160 1264 96
WIRE 1264 208 1328 208
WIRE 208 528 208 464
WIRE 160 608 96 608
WIRE 208 624 208 688
WIRE 208 576 272 576
WIRE 736 528 736 464
WIRE 688 608 624 608
WIRE 736 624 736 688
WIRE 736 576 800 576
WIRE 1264 624 1264 688
WIRE 1216 544 1152 544
WIRE 1264 528 1264 464
WIRE 1264 576 1328 576
WIRE 208 992 208 1056
WIRE 160 912 96 912
WIRE 208 896 208 832
WIRE 208 944 272 944
WIRE 736 896 736 832
WIRE 688 976 624 976
WIRE 736 992 736 1056
WIRE 736 944 800 944
WIRE 1264 896 1264 832
WIRE 1216 976 1152 976
WIRE 1264 992 1264 1056
WIRE 1264 944 1328 944
FLAG 208 320 SP
IOPIN 208 320 BiDir
FLAG 96 176 BP
IOPIN 96 176 BiDir
FLAG 208 96 VDD
IOPIN 208 96 BiDir
FLAG 272 208 VDD
IOPIN 272 208 BiDir
FLAG 736 320 PA
IOPIN 736 320 BiDir
FLAG 624 176 INP
IOPIN 624 176 BiDir
FLAG 736 96 SP
IOPIN 736 96 BiDir
FLAG 800 208 VDD
IOPIN 800 208 BiDir
FLAG 1264 320 PB
IOPIN 1264 320 BiDir
FLAG 1152 176 INM
IOPIN 1152 176 BiDir
FLAG 1264 96 SP
IOPIN 1264 96 BiDir
FLAG 1328 208 VDD
IOPIN 1328 208 BiDir
FLAG 208 464 PA
IOPIN 208 464 BiDir
FLAG 96 608 PA
IOPIN 96 608 BiDir
FLAG 208 688 VSS
IOPIN 208 688 BiDir
FLAG 272 576 VSS
IOPIN 272 576 BiDir
FLAG 736 464 PAA
IOPIN 736 464 BiDir
FLAG 624 608 PA
IOPIN 624 608 BiDir
FLAG 736 688 VSS
IOPIN 736 688 BiDir
FLAG 800 576 VSS
IOPIN 800 576 BiDir
FLAG 1264 688 PAA
IOPIN 1264 688 BiDir
FLAG 1152 544 PAA
IOPIN 1152 544 BiDir
FLAG 1264 464 VDD
IOPIN 1264 464 BiDir
FLAG 1328 576 VDD
IOPIN 1328 576 BiDir
FLAG 208 1056 G2
IOPIN 208 1056 BiDir
FLAG 96 912 PAA
IOPIN 96 912 BiDir
FLAG 208 832 VDD
IOPIN 208 832 BiDir
FLAG 272 944 VDD
IOPIN 272 944 BiDir
FLAG 736 832 PB
IOPIN 736 832 BiDir
FLAG 624 976 PB
IOPIN 624 976 BiDir
FLAG 736 1056 VSS
IOPIN 736 1056 BiDir
FLAG 800 944 VSS
IOPIN 800 944 BiDir
FLAG 1264 832 G2
IOPIN 1264 832 BiDir
FLAG 1152 976 PB
IOPIN 1152 976 BiDir
FLAG 1264 1056 VSS
IOPIN 1264 1056 BiDir
FLAG 1328 944 VSS
IOPIN 1328 944 BiDir
SYMBOL pmos4 160 256 M180
WINDOW 0 208 80 Left 2
WINDOW 3 208 48 Left 2
SYMATTR InstName XPTAIL
SYMATTR Value SKY_P1
SYMATTR SpiceLine w=7 l=4 mult=10
SYMATTR Prefix X
SYMBOL pmos4 688 256 M180
WINDOW 0 208 80 Left 2
WINDOW 3 208 48 Left 2
SYMATTR InstName XPPLUS
SYMATTR Value SKY_P1
SYMATTR SpiceLine w=7 l=2 mult=32
SYMATTR Prefix X
SYMBOL pmos4 1216 256 M180
WINDOW 0 208 80 Left 2
WINDOW 3 208 48 Left 2
SYMATTR InstName XPMINUS
SYMATTR Value SKY_P1
SYMATTR SpiceLine w=7 l=2 mult=32
SYMATTR Prefix X
SYMBOL nmos4 160 528 R0
WINDOW 0 208 16 Left 2
WINDOW 3 208 48 Left 2
SYMATTR InstName XNPA
SYMATTR Value SKY_N1
SYMATTR SpiceLine w=7 l=8 mult=16
SYMATTR Prefix X
SYMBOL nmos4 688 528 R0
WINDOW 0 208 16 Left 2
WINDOW 3 208 48 Left 2
SYMATTR InstName XNPAX
SYMATTR Value SKY_N1
SYMATTR SpiceLine w=7 l=8 mult=16
SYMATTR Prefix X
SYMBOL pmos4 1216 624 M180
WINDOW 0 208 80 Left 2
WINDOW 3 208 48 Left 2
SYMATTR InstName XPPAA
SYMATTR Value SKY_P1
SYMATTR SpiceLine w=7 l=8 mult=32
SYMATTR Prefix X
SYMBOL pmos4 160 992 M180
WINDOW 0 208 80 Left 2
WINDOW 3 208 48 Left 2
SYMATTR InstName XPPAX
SYMATTR Value SKY_P1
SYMATTR SpiceLine w=7 l=8 mult=32
SYMATTR Prefix X
SYMBOL nmos4 688 896 R0
WINDOW 0 208 16 Left 2
WINDOW 3 208 48 Left 2
SYMATTR InstName XNPB
SYMATTR Value SKY_N1
SYMATTR SpiceLine w=7 l=8 mult=16
SYMATTR Prefix X
SYMBOL nmos4 1216 896 R0
WINDOW 0 208 16 Left 2
WINDOW 3 208 48 Left 2
SYMATTR InstName XNPBX
SYMATTR Value SKY_N1
SYMATTR SpiceLine w=7 l=8 mult=16
SYMATTR Prefix X
TEXT 368 240 Left 2 ;7/4 x10
TEXT 896 240 Left 2 ;7/2 x32
TEXT 1424 240 Left 2 ;7/2 x32
TEXT 368 608 Left 2 ;7/8 x16
TEXT 896 608 Left 2 ;7/8 x16
TEXT 1424 608 Left 2 ;7/8 x32
TEXT 368 976 Left 2 ;7/8 x32
TEXT 896 976 Left 2 ;7/8 x16
TEXT 1424 976 Left 2 ;7/8 x16

sky_inputn.asc, the sub-circuit schematic file:
Version 4.1
SHEET 1 1728 1408
WIRE 208 160 208 96
WIRE 160 240 96 240
WIRE 208 256 208 320
WIRE 208 208 272 208
WIRE 736 160 736 96
WIRE 688 240 624 240
WIRE 736 256 736 320
WIRE 736 208 800 208
WIRE 1264 160 1264 96
WIRE 1216 240 1152 240
WIRE 1264 256 1264 320
WIRE 1264 208 1328 208
WIRE 208 624 208 688
WIRE 160 544 96 544
WIRE 208 528 208 464
WIRE 208 576 272 576
WIRE 736 624 736 688
WIRE 688 544 624 544
WIRE 736 528 736 464
WIRE 736 576 800 576
WIRE 1264 528 1264 464
WIRE 1216 608 1152 608
WIRE 1264 624 1264 688
WIRE 1264 576 1328 576
WIRE 208 896 208 832
WIRE 160 976 96 976
WIRE 208 992 208 1056
WIRE 208 944 272 944
WIRE 736 992 736 1056
WIRE 688 912 624 912
WIRE 736 896 736 832
WIRE 736 944 800 944
WIRE 1264 992 1264 1056
WIRE 1216 912 1152 912
WIRE 1264 896 1264 832
WIRE 1264 944 1328 944
FLAG 208 96 SN
IOPIN 208 96 BiDir
FLAG 96 240 IBIAS
IOPIN 96 240 BiDir
FLAG 208 320 VSS
IOPIN 208 320 BiDir
FLAG 272 208 VSS
IOPIN 272 208 BiDir
FLAG 736 96 NA
IOPIN 736 96 BiDir
FLAG 624 240 INP
IOPIN 624 240 BiDir
FLAG 736 320 SN
IOPIN 736 320 BiDir
FLAG 800 208 VSS
IOPIN 800 208 BiDir
FLAG 1264 96 NB
IOPIN 1264 96 BiDir
FLAG 1152 240 INM
IOPIN 1152 240 BiDir
FLAG 1264 320 SN
IOPIN 1264 320 BiDir
FLAG 1328 208 VSS
IOPIN 1328 208 BiDir
FLAG 208 688 NA
IOPIN 208 688 BiDir
FLAG 96 544 NA
IOPIN 96 544 BiDir
FLAG 208 464 VDD
IOPIN 208 464 BiDir
FLAG 272 576 VDD
IOPIN 272 576 BiDir
FLAG 736 688 NAA
IOPIN 736 688 BiDir
FLAG 624 544 NA
IOPIN 624 544 BiDir
FLAG 736 464 VDD
IOPIN 736 464 BiDir
FLAG 800 576 VDD
IOPIN 800 576 BiDir
FLAG 1264 464 NAA
IOPIN 1264 464 BiDir
FLAG 1152 608 NAA
IOPIN 1152 608 BiDir
FLAG 1264 688 VSS
IOPIN 1264 688 BiDir
FLAG 1328 576 VSS
IOPIN 1328 576 BiDir
FLAG 208 832 G2
IOPIN 208 832 BiDir
FLAG 96 976 NAA
IOPIN 96 976 BiDir
FLAG 208 1056 VSS
IOPIN 208 1056 BiDir
FLAG 272 944 VSS
IOPIN 272 944 BiDir
FLAG 736 1056 NB
IOPIN 736 1056 BiDir
FLAG 624 912 NB
IOPIN 624 912 BiDir
FLAG 736 832 VDD
IOPIN 736 832 BiDir
FLAG 800 944 VDD
IOPIN 800 944 BiDir
FLAG 1264 1056 G2
IOPIN 1264 1056 BiDir
FLAG 1152 912 NB
IOPIN 1152 912 BiDir
FLAG 1264 832 VDD
IOPIN 1264 832 BiDir
FLAG 1328 944 VDD
IOPIN 1328 944 BiDir
SYMBOL nmos4 160 160 R0
WINDOW 0 208 16 Left 2
WINDOW 3 208 48 Left 2
SYMATTR InstName XNTAIL
SYMATTR Value SKY_N1
SYMATTR SpiceLine w=7 l=4 mult=10
SYMATTR Prefix X
SYMBOL nmos4 688 160 R0
WINDOW 0 208 16 Left 2
WINDOW 3 208 48 Left 2
SYMATTR InstName XNPLUS
SYMATTR Value SKY_N1
SYMATTR SpiceLine w=7 l=8 mult=8
SYMATTR Prefix X
SYMBOL nmos4 1216 160 R0
WINDOW 0 208 16 Left 2
WINDOW 3 208 48 Left 2
SYMATTR InstName XNMINUS
SYMATTR Value SKY_N1
SYMATTR SpiceLine w=7 l=8 mult=8
SYMATTR Prefix X
SYMBOL pmos4 160 624 M180
WINDOW 0 208 80 Left 2
WINDOW 3 208 48 Left 2
SYMATTR InstName XPNA
SYMATTR Value SKY_P1
SYMATTR SpiceLine w=7 l=0.25 mult=128
SYMATTR Prefix X
SYMBOL pmos4 688 624 M180
WINDOW 0 208 80 Left 2
WINDOW 3 208 48 Left 2
SYMATTR InstName XPNAX
SYMATTR Value SKY_P1
SYMATTR SpiceLine w=7 l=0.25 mult=128
SYMATTR Prefix X
SYMBOL nmos4 1216 528 R0
WINDOW 0 208 16 Left 2
WINDOW 3 208 48 Left 2
SYMATTR InstName XNNAA
SYMATTR Value SKY_N1
SYMATTR SpiceLine w=7 l=8 mult=16
SYMATTR Prefix X
SYMBOL nmos4 160 896 R0
WINDOW 0 208 16 Left 2
WINDOW 3 208 48 Left 2
SYMATTR InstName XNNAX
SYMATTR Value SKY_N1
SYMATTR SpiceLine w=7 l=8 mult=16
SYMATTR Prefix X
SYMBOL pmos4 688 992 M180
WINDOW 0 208 80 Left 2
WINDOW 3 208 48 Left 2
SYMATTR InstName XPNB
SYMATTR Value SKY_P1
SYMATTR SpiceLine w=7 l=0.25 mult=128
SYMATTR Prefix X
SYMBOL pmos4 1216 992 M180
WINDOW 0 208 80 Left 2
WINDOW 3 208 48 Left 2
SYMATTR InstName XPNBX
SYMATTR Value SKY_P1
SYMATTR SpiceLine w=7 l=0.25 mult=128
SYMATTR Prefix X
TEXT 368 240 Left 2 ;7/4 x10
TEXT 896 240 Left 2 ;7/8 x8
TEXT 1424 240 Left 2 ;7/8 x8
TEXT 368 608 Left 2 ;7/0.25 x128
TEXT 896 608 Left 2 ;7/0.25 x128
TEXT 1424 608 Left 2 ;7/8 x16
TEXT 368 976 Left 2 ;7/8 x16
TEXT 896 976 Left 2 ;7/0.25 x128
TEXT 1424 976 Left 2 ;7/0.25 x128

sky_output.asc, the sub-circuit schematic file:
Version 4.1
SHEET 1 1728 800
WIRE 208 256 208 320
WIRE 160 176 96 176
WIRE 208 160 208 96
WIRE 208 208 272 208
WIRE 736 160 736 96
WIRE 688 240 624 240
WIRE 736 256 736 320
WIRE 736 208 800 208
WIRE 448 576 384 576
WIRE 528 576 720 576
WIRE 488 624 488 688
WIRE 784 576 880 576
FLAG 208 320 OUT
IOPIN 208 320 BiDir
FLAG 96 176 BP
IOPIN 96 176 BiDir
FLAG 208 96 VDD
IOPIN 208 96 BiDir
FLAG 272 208 VDD
IOPIN 272 208 BiDir
FLAG 736 96 OUT
IOPIN 736 96 BiDir
FLAG 624 240 G2
IOPIN 624 240 BiDir
FLAG 736 320 VSS
IOPIN 736 320 BiDir
FLAG 800 208 VSS
IOPIN 800 208 BiDir
FLAG 384 576 G2
IOPIN 384 576 BiDir
FLAG 488 688 VSS
IOPIN 488 688 BiDir
FLAG 880 576 OUT
IOPIN 880 576 BiDir
SYMBOL pmos4 160 256 M180
WINDOW 0 208 80 Left 2
WINDOW 3 208 48 Left 2
SYMATTR InstName XPOUT
SYMATTR Value SKY_P1
SYMATTR SpiceLine w=7 l=4 mult=100
SYMATTR Prefix X
SYMBOL nmos4 688 160 R0
WINDOW 0 208 16 Left 2
WINDOW 3 208 48 Left 2
SYMATTR InstName XNOUT
SYMATTR Value SKY_N1
SYMATTR SpiceLine w=7 l=1 mult=36
SYMATTR Prefix X
SYMBOL Sky_R 544 560 R90
WINDOW 0 -32 112 Left 2
WINDOW 3 96 112 Left 2
SYMATTR InstName XRC
SYMATTR Value SKY_R
SYMATTR SpiceLine l={RCOMP_L}
SYMATTR Prefix X
SYMBOL Sky_C 720 592 R270
WINDOW 0 64 32 Left 2
WINDOW 3 -64 32 Left 2
SYMATTR InstName XCC
SYMATTR Value SKY_C
SYMATTR SpiceLine w={CC_SIDE} l={CC_SIDE}
SYMATTR Prefix X
TEXT 368 240 Left 2 ;7/4 x100
TEXT 896 240 Left 2 ;7/1 x36
TEXT 368 736 Left 2 ;Set length with RCOMP_L
TEXT 752 736 Left 2 ;Set capacitance with CCOMP

The netlist it stands for:
* DAC6_Sky130_Core.asc
X§XCONTROL D0 D1 D2 D3 D4 D5 EN VDDA VSS S0 S0B S1 S1B S2 S2B S3 S3B S4 S4B S5 S5B E EB dac_control
X§XSTRING VREFL VREFH S0 S0B S1 S1B S2 S2B S3 S3B S4 S4B S5 S5B VDDA VSS VTAP dac_string64
X§XENABLE VREFL VTAP E EB VDDA VSS DAC_IN dac_mux2
X§XBUFFER DAC_IN VDDA VSS IBIAS VOUT dac_buffer

* block symbol definitions
.subckt dac_control D0 D1 D2 D3 D4 D5 EN VDDA VSS S0 S0B S1 S1B S2 S2B S3 S3B S4 S4B S5 S5B E EB
X§XD0_B D0 S0B VDDA VSS cmos_inv
X§XD0_T S0B S0 VDDA VSS cmos_inv
X§XD1_B D1 S1B VDDA VSS cmos_inv
X§XD1_T S1B S1 VDDA VSS cmos_inv
X§XD2_B D2 S2B VDDA VSS cmos_inv
X§XD2_T S2B S2 VDDA VSS cmos_inv
X§XD3_B D3 S3B VDDA VSS cmos_inv
X§XD3_T S3B S3 VDDA VSS cmos_inv
X§XD4_B D4 S4B VDDA VSS cmos_inv
X§XD4_T S4B S4 VDDA VSS cmos_inv
X§XD5_B D5 S5B VDDA VSS cmos_inv
X§XD5_T S5B S5 VDDA VSS cmos_inv
X§XEN_B EN EB VDDA VSS cmos_inv
X§XEN_T EB E VDDA VSS cmos_inv
.ends dac_control

.subckt cmos_inv A Z VDD VSS
X§XP Z A VDD VDD SKY_P1 w=1 l=0.15 mult=2  ; pins D G S B
X§XN Z A VSS VSS SKY_N1 w=1 l=0.15 mult=1  ; pins D G S B
.ends cmos_inv

.subckt dac_string64 VREFL VREFH S0 S0B S1 S1B S2 S2B S3 S3B S4 S4B S5 S5B VDD VSS TAP
X§XBANK0 VREFL J1 S0 S0B S1 S1B S2 S2B VDD VSS B0 dac_bank8
X§XBANK1 J1 J2 S0 S0B S1 S1B S2 S2B VDD VSS B1 dac_bank8
X§XBANK2 J2 J3 S0 S0B S1 S1B S2 S2B VDD VSS B2 dac_bank8
X§XBANK3 J3 J4 S0 S0B S1 S1B S2 S2B VDD VSS B3 dac_bank8
X§XBANK4 J4 J5 S0 S0B S1 S1B S2 S2B VDD VSS B4 dac_bank8
X§XBANK5 J5 J6 S0 S0B S1 S1B S2 S2B VDD VSS B5 dac_bank8
X§XBANK6 J6 J7 S0 S0B S1 S1B S2 S2B VDD VSS B6 dac_bank8
X§XBANK7 J7 VREFH S0 S0B S1 S1B S2 S2B VDD VSS B7 dac_bank8
X§XBANKSEL B0 B1 B2 B3 B4 B5 B6 B7 S3 S3B S4 S4B S5 S5B VDD VSS TAP dac_mux8
.ends dac_string64

.subckt dac_bank8 LO HI S0 S0B S1 S1B S2 S2B VDD VSS Y
X§XR1 T1 LO VSS SKY_R1K  ; pins A B SUB
X§XR2 T2 T1 VSS SKY_R1K  ; pins A B SUB
X§XR3 T3 T2 VSS SKY_R1K  ; pins A B SUB
X§XR4 T4 T3 VSS SKY_R1K  ; pins A B SUB
X§XR5 T5 T4 VSS SKY_R1K  ; pins A B SUB
X§XR6 T6 T5 VSS SKY_R1K  ; pins A B SUB
X§XR7 T7 T6 VSS SKY_R1K  ; pins A B SUB
X§XR8 HI T7 VSS SKY_R1K  ; pins A B SUB
X§XSELECT LO T1 T2 T3 T4 T5 T6 T7 S0 S0B S1 S1B S2 S2B VDD VSS Y dac_mux8
.ends dac_bank8

.subckt dac_mux8 I0 I1 I2 I3 I4 I5 I6 I7 S0 S0B S1 S1B S2 S2B VDD VSS Y
X§XM0_0 I0 I1 S0 S0B VDD VSS N0_0 dac_mux2
X§XM0_1 I2 I3 S0 S0B VDD VSS N0_1 dac_mux2
X§XM0_2 I4 I5 S0 S0B VDD VSS N0_2 dac_mux2
X§XM0_3 I6 I7 S0 S0B VDD VSS N0_3 dac_mux2
X§XM1_0 N0_0 N0_1 S1 S1B VDD VSS N1_0 dac_mux2
X§XM1_1 N0_2 N0_3 S1 S1B VDD VSS N1_1 dac_mux2
X§XM2_0 N1_0 N1_1 S2 S2B VDD VSS Y dac_mux2
.ends dac_mux8

.subckt dac_mux2 A B S SB VDD VSS Y
X§XTG0 A Y SB S VDD VSS cmos_tg
X§XTG1 B Y S SB VDD VSS cmos_tg
.ends dac_mux2

.subckt cmos_tg IN OUT EN ENB VDD VSS
X§XN OUT EN IN VSS SKY_N1 w=7 l=0.5 mult=4  ; pins D G S B
X§XP OUT ENB IN VDD SKY_P1 w=7 l=0.5 mult=8  ; pins D G S B
.ends cmos_tg

.subckt dac_buffer IN VDDA VSS IBIAS OUT
X§XOTA IN OUT VDDA VSS IBIAS OUT sky_ota
.ends dac_buffer

.subckt sky_ota INP INM VDD VSS IBIAS OUT
X§XBIAS VDD VSS IBIAS BP sky_bias
X§XPIN INP INM VDD VSS BP G2 sky_inputp
X§XNIN INP INM VDD VSS IBIAS G2 sky_inputn
X§XOUTPUT G2 BP VDD VSS OUT sky_output
.ends sky_ota

.subckt sky_bias VDD VSS IBIAS BP
X§XNREF IBIAS IBIAS VSS VSS SKY_N1 w=7 l=4 mult=1  ; pins D G S B
X§XNBIAS BP IBIAS VSS VSS SKY_N1 w=7 l=4 mult=1  ; pins D G S B
X§XPREF BP BP VDD VDD SKY_P1 w=7 l=4 mult=1  ; pins D G S B
* 7/4 x1
* 7/4 x1
* 7/4 x1
.ends sky_bias

.subckt sky_inputp INP INM VDD VSS BP G2
X§XPTAIL SP BP VDD VDD SKY_P1 w=7 l=4 mult=10  ; pins D G S B
X§XPPLUS PA INP SP VDD SKY_P1 w=7 l=2 mult=32  ; pins D G S B
X§XPMINUS PB INM SP VDD SKY_P1 w=7 l=2 mult=32  ; pins D G S B
X§XNPA PA PA VSS VSS SKY_N1 w=7 l=8 mult=16  ; pins D G S B
X§XNPAX PAA PA VSS VSS SKY_N1 w=7 l=8 mult=16  ; pins D G S B
X§XPPAA PAA PAA VDD VDD SKY_P1 w=7 l=8 mult=32  ; pins D G S B
X§XPPAX G2 PAA VDD VDD SKY_P1 w=7 l=8 mult=32  ; pins D G S B
X§XNPB PB PB VSS VSS SKY_N1 w=7 l=8 mult=16  ; pins D G S B
X§XNPBX G2 PB VSS VSS SKY_N1 w=7 l=8 mult=16  ; pins D G S B
* 7/4 x10
* 7/2 x32
* 7/2 x32
* 7/8 x16
* 7/8 x16
* 7/8 x32
* 7/8 x32
* 7/8 x16
* 7/8 x16
.ends sky_inputp

.subckt sky_inputn INP INM VDD VSS IBIAS G2
X§XNTAIL SN IBIAS VSS VSS SKY_N1 w=7 l=4 mult=10  ; pins D G S B
X§XNPLUS NA INP SN VSS SKY_N1 w=7 l=8 mult=8  ; pins D G S B
X§XNMINUS NB INM SN VSS SKY_N1 w=7 l=8 mult=8  ; pins D G S B
X§XPNA NA NA VDD VDD SKY_P1 w=7 l=0.25 mult=128  ; pins D G S B
X§XPNAX NAA NA VDD VDD SKY_P1 w=7 l=0.25 mult=128  ; pins D G S B
X§XNNAA NAA NAA VSS VSS SKY_N1 w=7 l=8 mult=16  ; pins D G S B
X§XNNAX G2 NAA VSS VSS SKY_N1 w=7 l=8 mult=16  ; pins D G S B
X§XPNB NB NB VDD VDD SKY_P1 w=7 l=0.25 mult=128  ; pins D G S B
X§XPNBX G2 NB VDD VDD SKY_P1 w=7 l=0.25 mult=128  ; pins D G S B
* 7/4 x10
* 7/8 x8
* 7/8 x8
* 7/0.25 x128
* 7/0.25 x128
* 7/8 x16
* 7/8 x16
* 7/0.25 x128
* 7/0.25 x128
.ends sky_inputn

.subckt sky_output G2 BP VDD VSS OUT
X§XPOUT OUT BP VDD VDD SKY_P1 w=7 l=4 mult=100  ; pins D G S B
X§XNOUT OUT G2 VSS VSS SKY_N1 w=7 l=1 mult=36  ; pins D G S B
X§XRC N001 G2 VSS SKY_R l={RCOMP_L}  ; pins A B SUB
X§XCC N001 OUT SKY_C w={CC_SIDE} l={CC_SIDE}  ; pins A B
* 7/4 x100
* 7/1 x36
* Set length with RCOMP_L
* Set capacitance with CCOMP
.ends sky_output

.backanno
.end